# Altium schematic sheet Atrium_Flex_Jumper.SchDoc
size 420 x 297 mm; Symbol: Drawing-Symbol_A3; @Project Name: Atrium; @Page Count: 1; @Update Date: 2026-11-08; @Create Date: 2026-11-08; @Schematic Name: Flex_Schematic; @Page No: 1; @Page Name: P1; Company: EasyEDA.com; Version: V1.0; Page Size: A3; Device: Drawing-Symbol_A3; @Create Time: 01:35:39; @Update Time: 01:35:39; Border: 1; Width: 1655; Height: 1170; Region Start: 1; X Region Count: 6; Y Region Count: 4; Blade Width: 10; Title Block Position: 3; @Board Name: Flex_Jumper
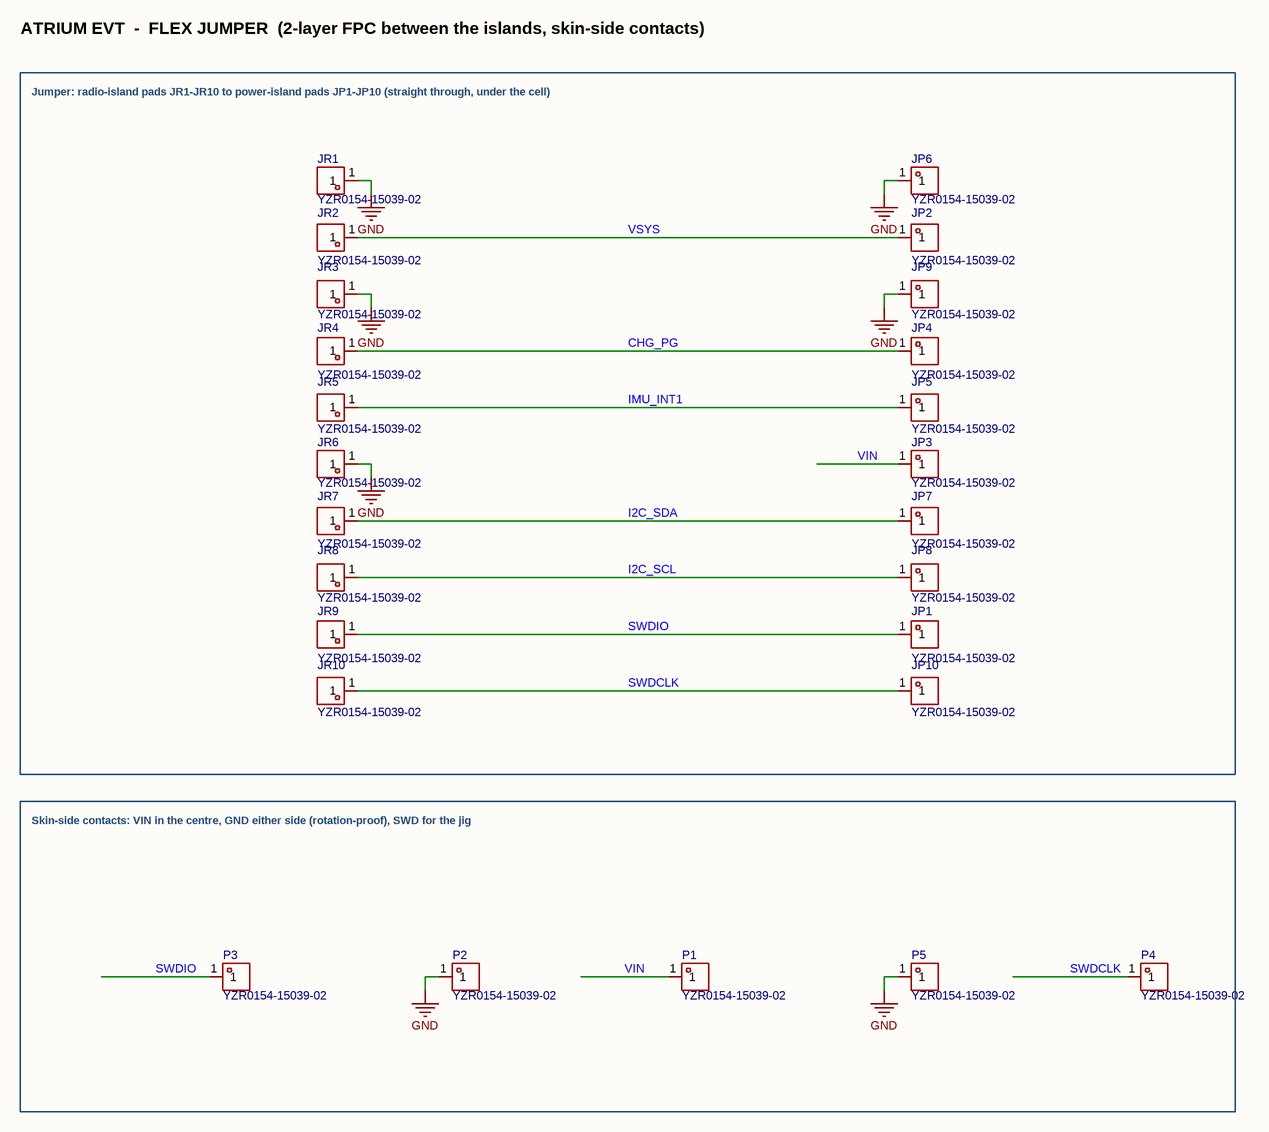
[diagram p0: Atrium_Flex_Jumper.SchDoc]

## Parts
JP1  YZR0154-15039-02  [TESTPOINT-SMD_BD1.5-H3.9]
JP2  YZR0154-15039-02  [TESTPOINT-SMD_BD1.5-H3.9]
JP3  YZR0154-15039-02  [TESTPOINT-SMD_BD1.5-H3.9]
JP4  YZR0154-15039-02  [TESTPOINT-SMD_BD1.5-H3.9]
JP5  YZR0154-15039-02  [TESTPOINT-SMD_BD1.5-H3.9]
JP6  YZR0154-15039-02  [TESTPOINT-SMD_BD1.5-H3.9]
JP7  YZR0154-15039-02  [TESTPOINT-SMD_BD1.5-H3.9]
JP8  YZR0154-15039-02  [TESTPOINT-SMD_BD1.5-H3.9]
JP9  YZR0154-15039-02  [TESTPOINT-SMD_BD1.5-H3.9]
JP10  YZR0154-15039-02  [TESTPOINT-SMD_BD1.5-H3.9]
JR1  YZR0154-15039-02  [TESTPOINT-SMD_BD1.5-H3.9]
JR2  YZR0154-15039-02  [TESTPOINT-SMD_BD1.5-H3.9]
JR3  YZR0154-15039-02  [TESTPOINT-SMD_BD1.5-H3.9]
JR4  YZR0154-15039-02  [TESTPOINT-SMD_BD1.5-H3.9]
JR5  YZR0154-15039-02  [TESTPOINT-SMD_BD1.5-H3.9]
JR6  YZR0154-15039-02  [TESTPOINT-SMD_BD1.5-H3.9]
JR7  YZR0154-15039-02  [TESTPOINT-SMD_BD1.5-H3.9]
JR8  YZR0154-15039-02  [TESTPOINT-SMD_BD1.5-H3.9]
JR9  YZR0154-15039-02  [TESTPOINT-SMD_BD1.5-H3.9]
JR10  YZR0154-15039-02  [TESTPOINT-SMD_BD1.5-H3.9]
P1  YZR0154-15039-02  [TESTPOINT-SMD_BD1.5-H3.9]
P2  YZR0154-15039-02  [TESTPOINT-SMD_BD1.5-H3.9]
P3  YZR0154-15039-02  [TESTPOINT-SMD_BD1.5-H3.9]
P4  YZR0154-15039-02  [TESTPOINT-SMD_BD1.5-H3.9]
P5  YZR0154-15039-02  [TESTPOINT-SMD_BD1.5-H3.9]

## Nets
GND: JP6.1 JP9.1 JR1.1 JR3.1 JR6.1 P2.1 P5.1
CHG_PG: JP4.1 JR4.1
I2C_SCL: JP8.1 JR8.1
I2C_SDA: JP7.1 JR7.1
IMU_INT1: JP5.1 JR5.1
SWDCLK: JP10.1 JR10.1 P4.1
SWDIO: JP1.1 JR9.1 P3.1
VIN: JP3.1 P1.1
VSYS: JP2.1 JR2.1

## Notes on the sheet
- ATRIUM EVT  -  FLEX JUMPER  (2-layer FPC between the islands, skin-side contacts)
- Jumper: radio-island pads JR1-JR10 to power-island pads JP1-JP10 (straight through, under the cell)
- Skin-side contacts: VIN in the centre, GND either side (rotation-proof), SWD for the jig
- Create at
- 2026-11-08
- Schematic
- Board
- Flex_Schematic
- Flex_Jumper
- Update at
- Page
- P1
- Drawn
- Reviewed
- Atrium
- Version
- V1.0
- Size
- A3
- Page  1  Total  1
- EasyEDA.com

## Library data of the parts
JP1-JP10 JR1-JR10 P1-P5 = YZR0154-15039-02: Type:Pogo Pin Number of Pins:1P Overall Length/Height:3.9mm Operational Height:3.1mm Contact Resistance:50mΩ Elastic Life:10000 times Current Rating:1A Voltage Rating:12V Contact Material:Lead-Free Copper Contact Plating:Gold Operating Temperature:-20℃~+7; Manufacturer: Xinyangze(鑫扬泽); Add into BOM: no; Overall Length/Height: 3.9mm; Operational Height: 3.1mm; Contact Resistance: 50mΩ; Current Rating: 1A; Voltage Rating: 12V; Symbol: YZR0154-15039-02; Device: YZR0154-15039-02; Convert to PCB: no; LCSC Part Name: POGO PIN贴片型弹簧顶针; Supplier Part: C5157388; Manufacturer Part: YZR0154-15039-02; Supplier Footprint: -; JLCPCB Part Class: Extended Part; Datasheet: https://item.szlcsc.com/datasheet/YZR0154-15039-02/5795506.html; Supplier: LCSC; Type: Pogo Pin; Number of Pins: 1P; Elastic Life: 10000 times; Contact Material: Lead-Free Copper; Contact Plating: Gold; Operating Temperature: -20℃~+70℃; FootprintName: TESTPOINT-SMD_BD1.5-H3.9